# Altium schematic sheet Final_project_schematic.SchDoc
size A; SheetNumber: 3; SheetTotal: 3
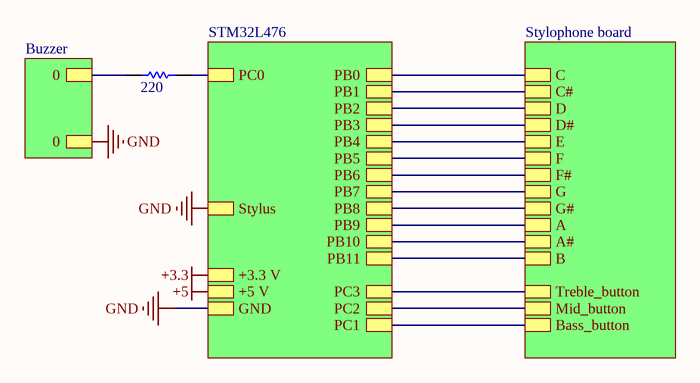
[diagram p0: Final_project_schematic.SchDoc]

## Parts
?  value 220  (hidden comment: Resistor)

## Sub-sheets
Buzzer = File Name: 0, 0
STM32L476 = File Name: PB0, PB1, PB2, PB3, PB4, PB6, PB7, PB8, PB9, PC0, PC1, PC2, PC3, +3.3 V, +5 V, GND, PB5, PB10, PB11, Stylus
Stylophone board = ?: C, C#, D, D#, E, F, F#, G, G#, A, A#, B, Treble_button, Mid_button, Bass_button

## Nets
+3.3: sheet STM32L476/+3.3 V
+5: sheet STM32L476/+5 V
GND: sheet STM32L476/GND, sheet STM32L476/Stylus, sheet Buzzer/0
Net?_1: ?.1 ; sheet STM32L476/PC0
Net?_2: ?.2 ; sheet Buzzer/0
(unnamed): sheet STM32L476/PB0, sheet Stylophone board/C
(unnamed): sheet STM32L476/PB1, sheet Stylophone board/C#
(unnamed): sheet STM32L476/PB2, sheet Stylophone board/D
(unnamed): sheet STM32L476/PB3, sheet Stylophone board/D#
(unnamed): sheet STM32L476/PB4, sheet Stylophone board/E
(unnamed): sheet STM32L476/PB6, sheet Stylophone board/F#
(unnamed): sheet STM32L476/PB7, sheet Stylophone board/G
(unnamed): sheet STM32L476/PB8, sheet Stylophone board/G#
(unnamed): sheet STM32L476/PB9, sheet Stylophone board/A
(unnamed): sheet STM32L476/PC1, sheet Stylophone board/Bass_button
(unnamed): sheet STM32L476/PC2, sheet Stylophone board/Mid_button
(unnamed): sheet STM32L476/PC3, sheet Stylophone board/Treble_button
(unnamed): sheet STM32L476/PB5, sheet Stylophone board/F
(unnamed): sheet STM32L476/PB10, sheet Stylophone board/A#
(unnamed): sheet STM32L476/PB11, sheet Stylophone board/B

## Library data of the parts
? = Resistor: TC1: 0; SimulationGenericComponent: True; TC2: 0